# Altium project BYD_Leg_OneLeg.PrjPcb
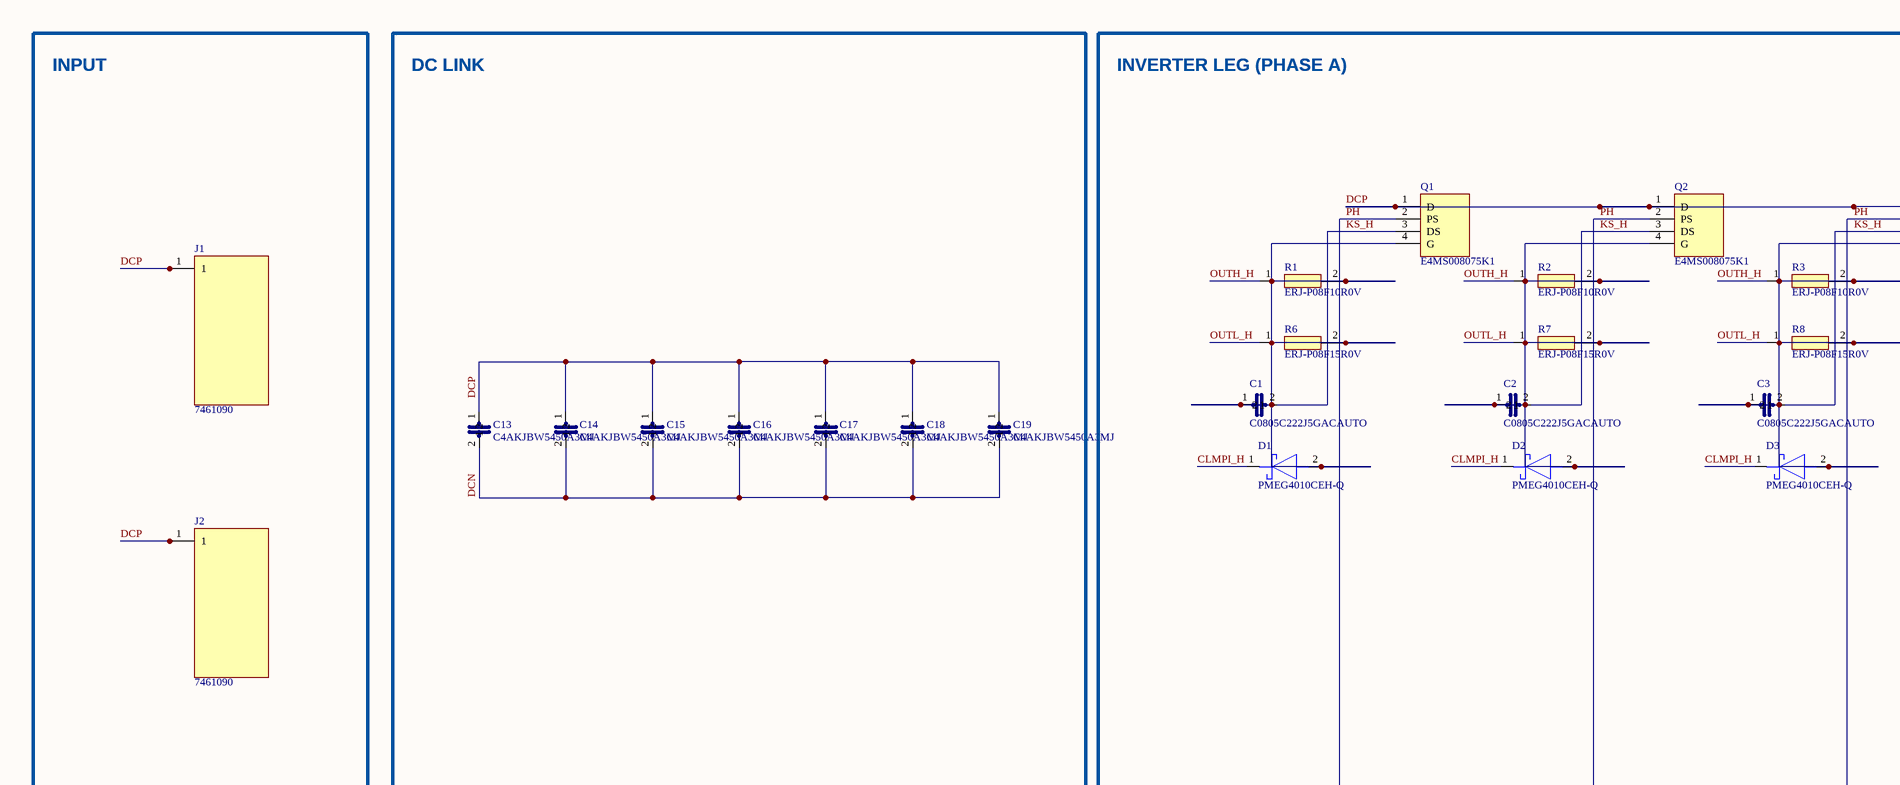
[diagram p0: BYD_Leg_OneLeg.SchDoc, top left]
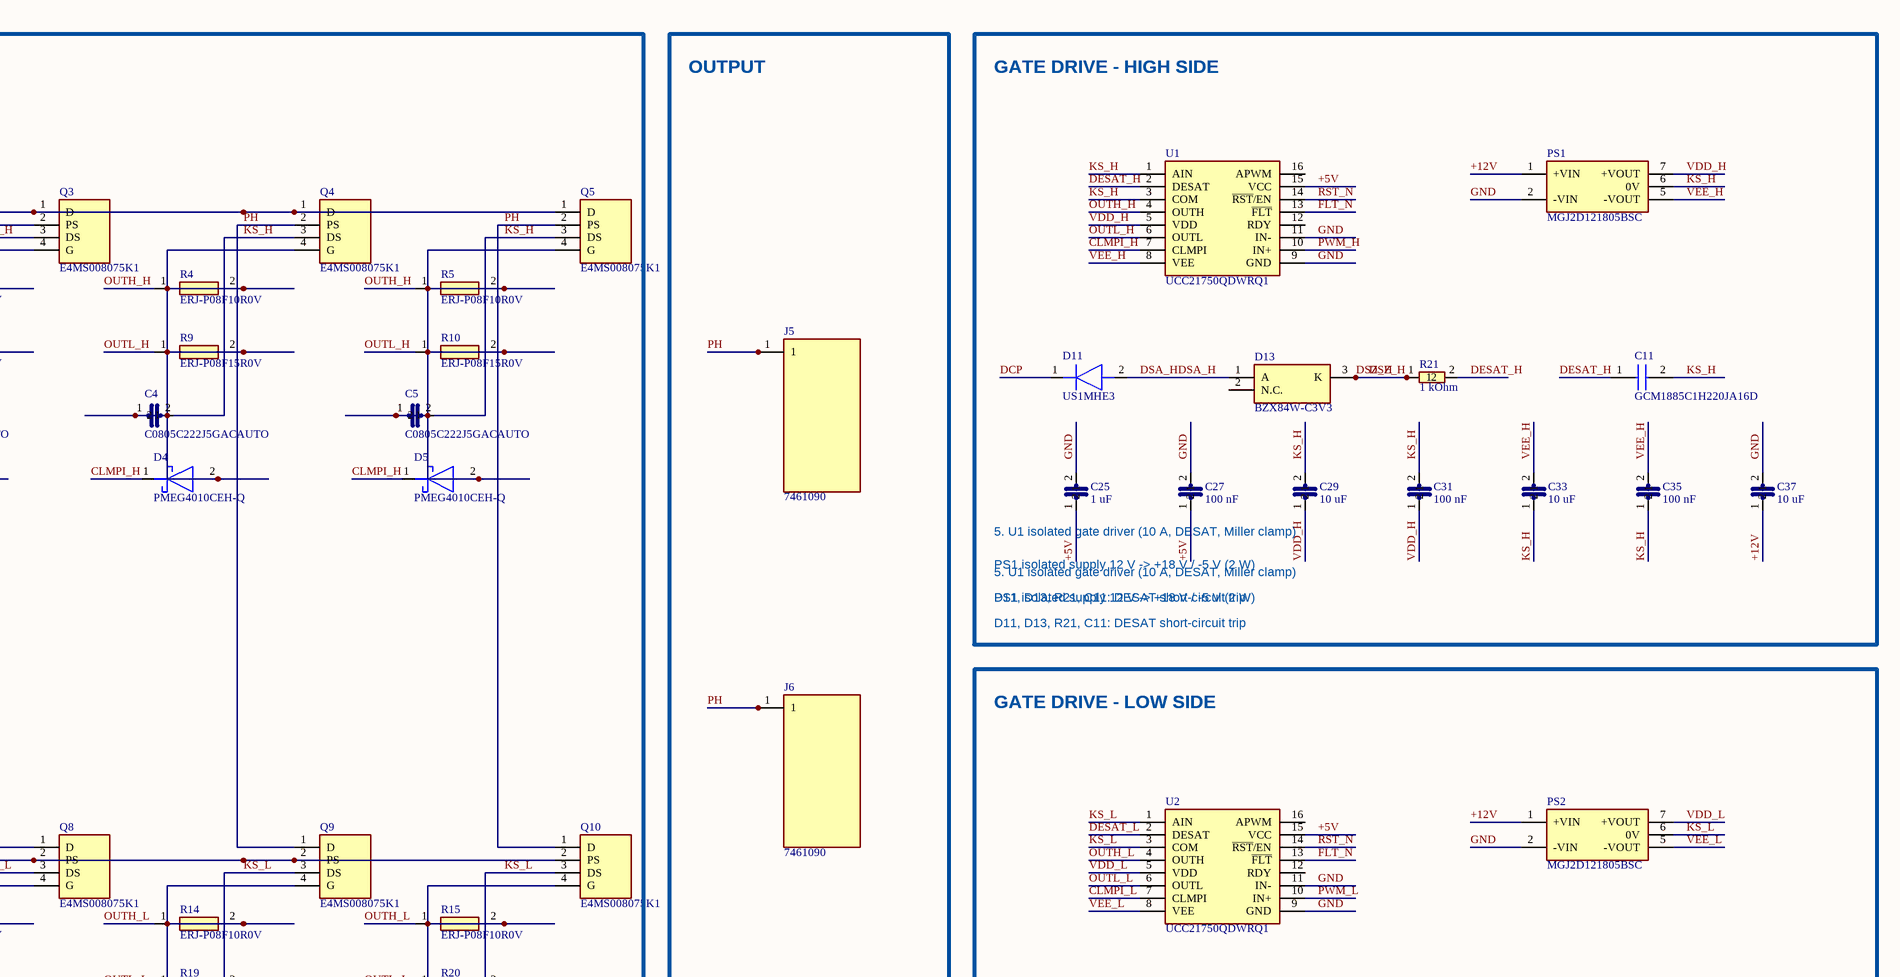
[diagram p1: BYD_Leg_OneLeg.SchDoc, top right]
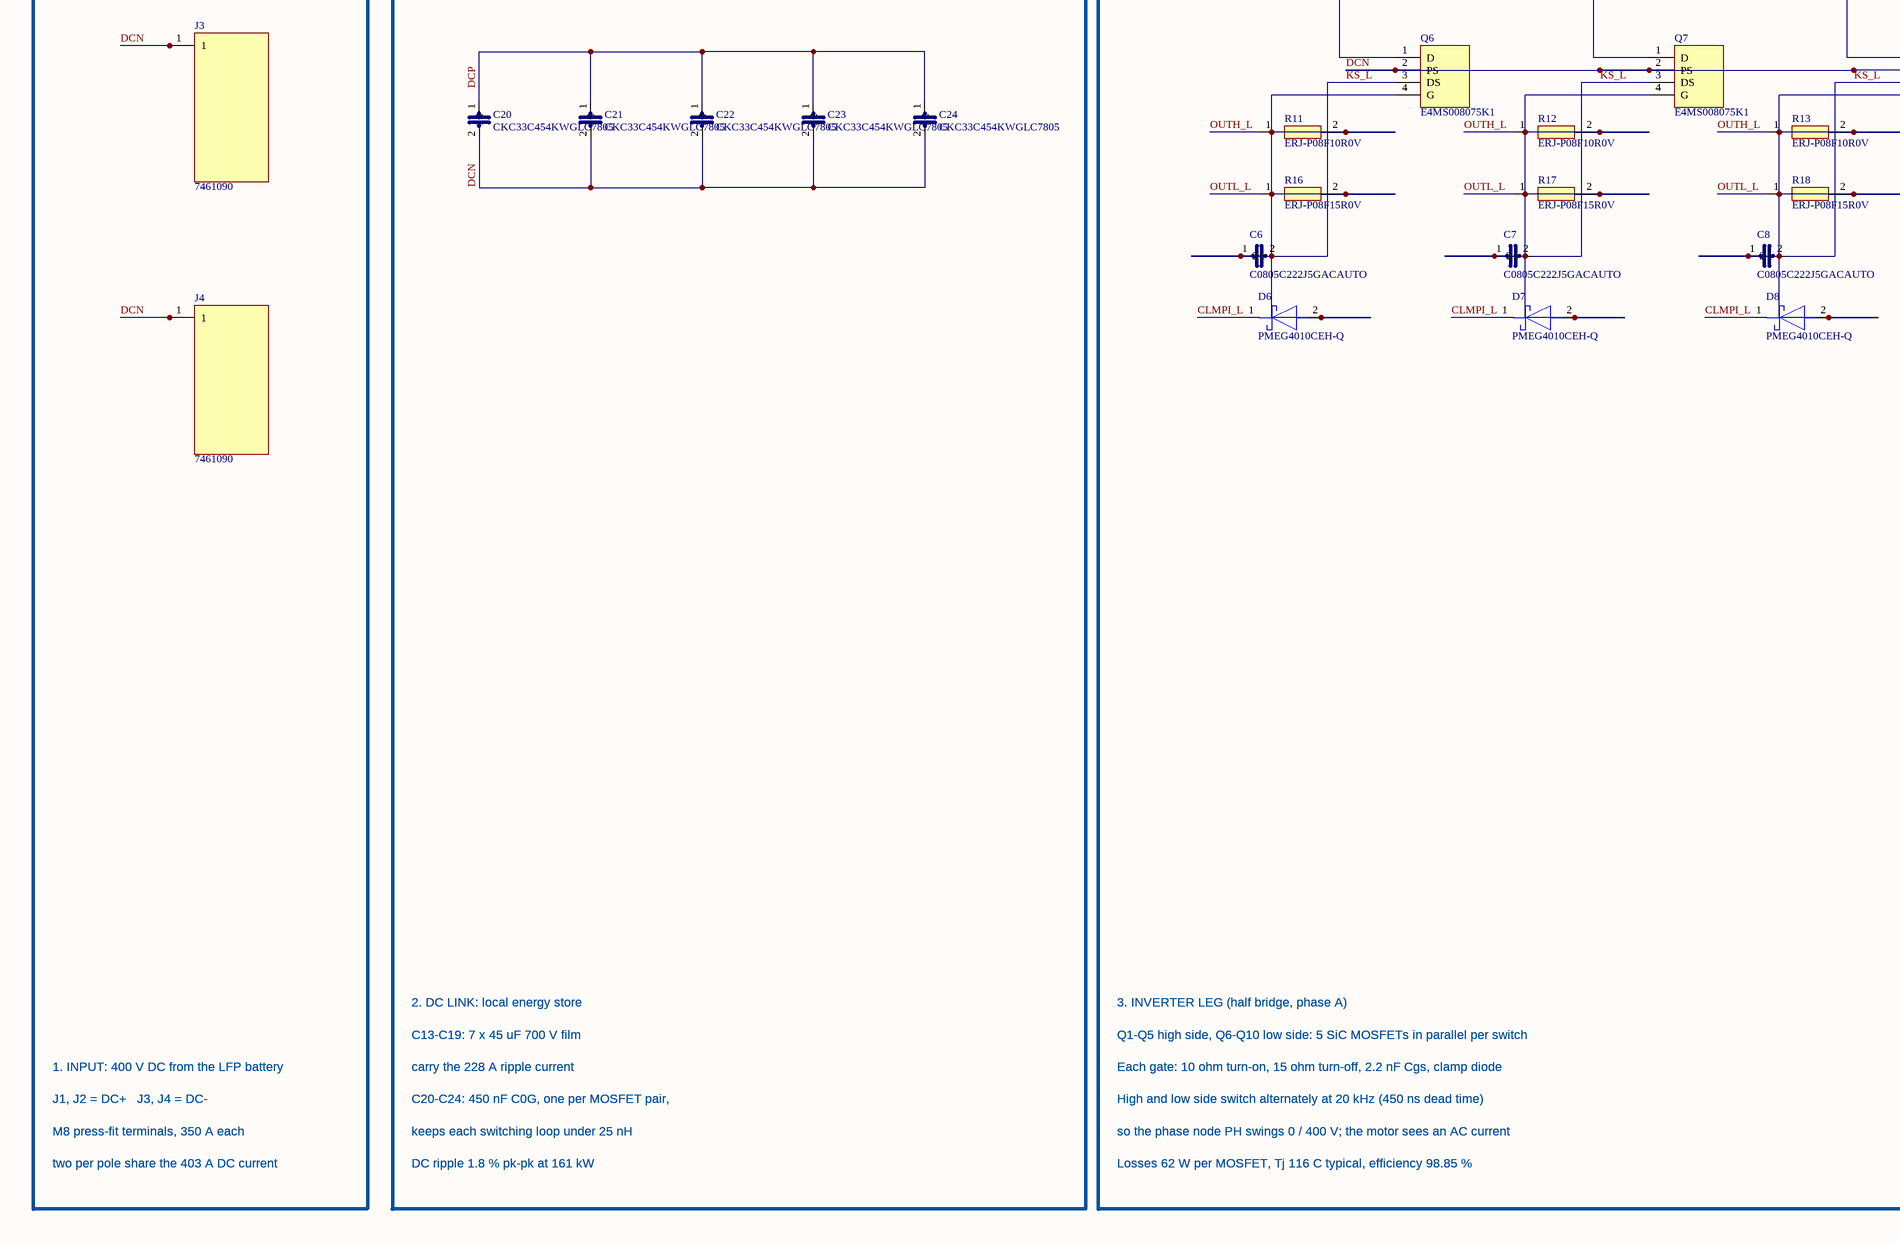
[diagram p2: BYD_Leg_OneLeg.SchDoc, bottom left]
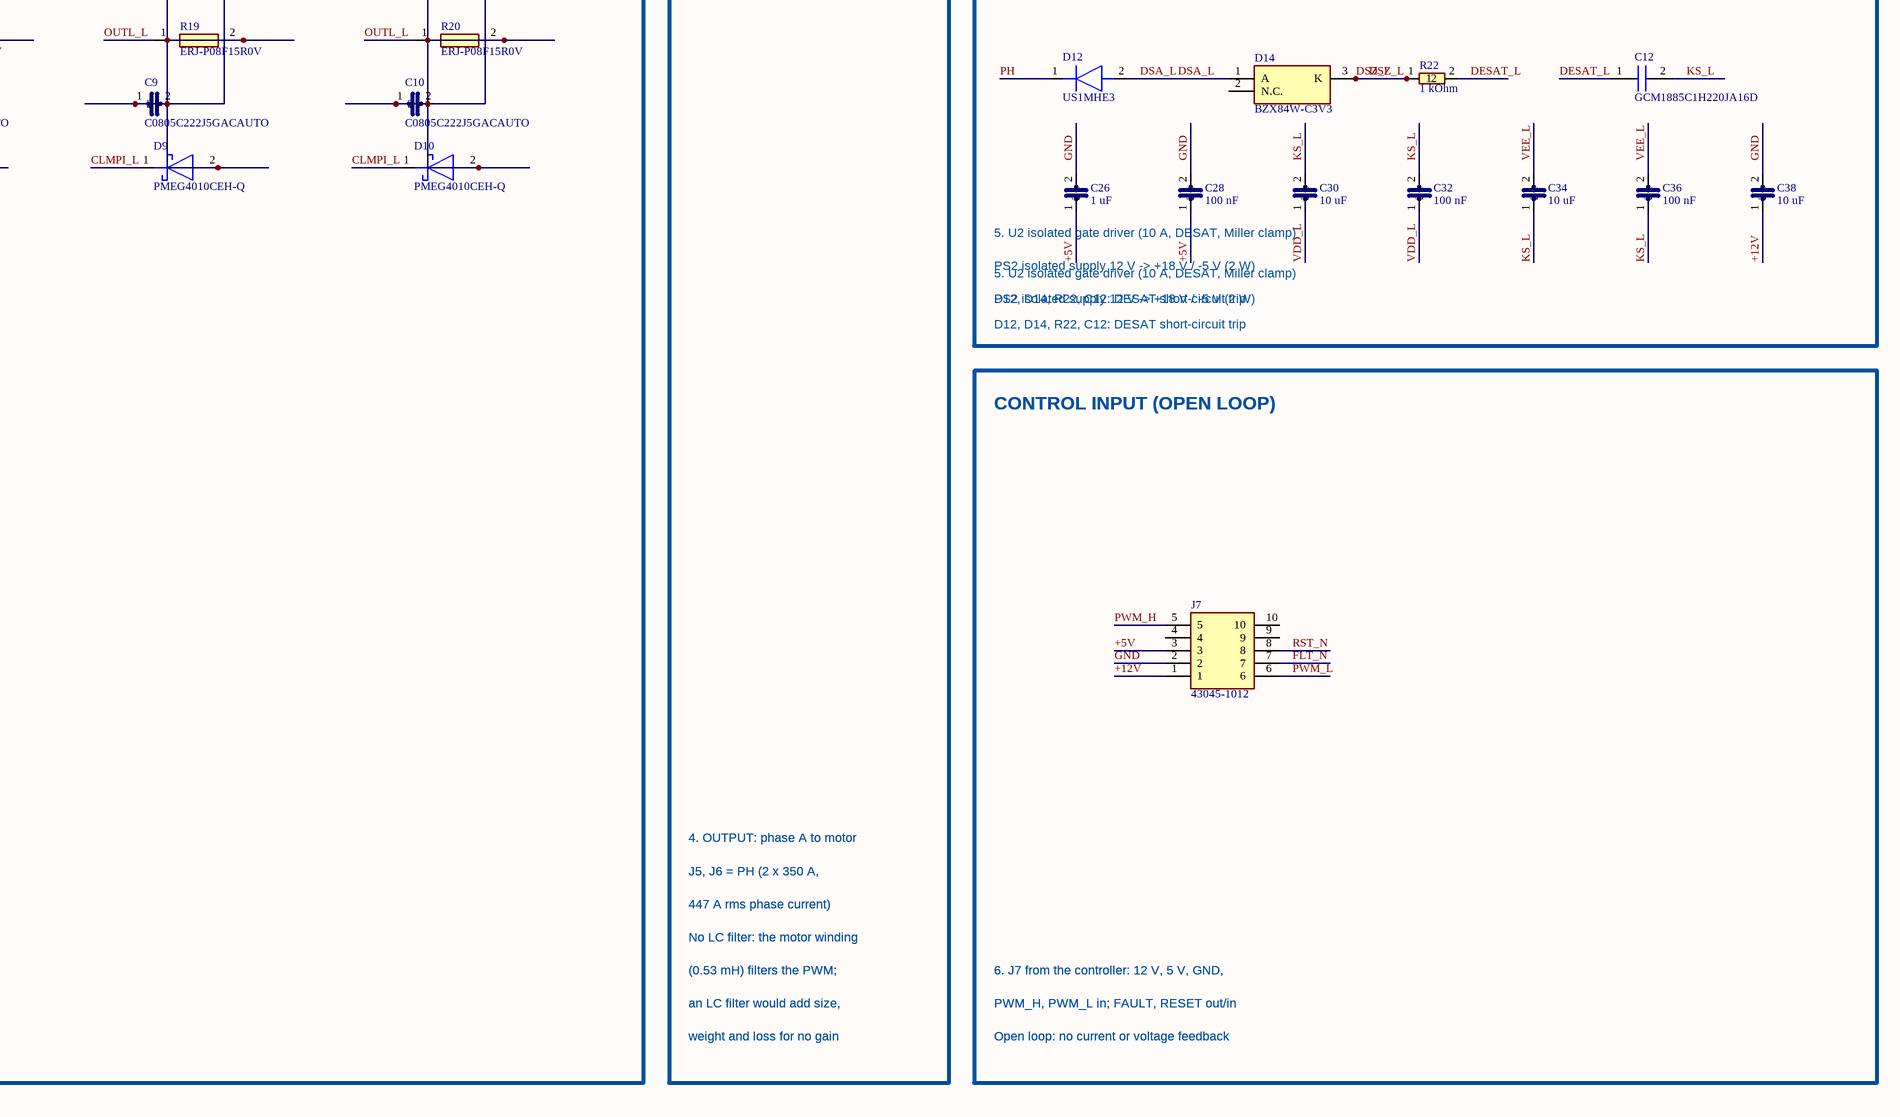
[diagram p3: BYD_Leg_OneLeg.SchDoc, bottom right]
1 sheet, 95 parts. Net scope: global (net labels, ports and power ports of the same name join across sheets).
Board file: BYD_Leg_OneLeg.PcbDoc

## Sheet BYD_Leg_OneLeg.SchDoc
size 762 x 469 mm

### Parts
C1  C0805C222J5GACAUTO  [CAPC2012_0805]
C2  C0805C222J5GACAUTO  [CAPC2012_0805]
C3  C0805C222J5GACAUTO  [CAPC2012_0805]
C4  C0805C222J5GACAUTO  [CAPC2012_0805]
C5  C0805C222J5GACAUTO  [CAPC2012_0805]
C6  C0805C222J5GACAUTO  [CAPC2012_0805]
C7  C0805C222J5GACAUTO  [CAPC2012_0805]
C8  C0805C222J5GACAUTO  [CAPC2012_0805]
C9  C0805C222J5GACAUTO  [CAPC2012_0805]
C10  C0805C222J5GACAUTO  [CAPC2012_0805]
C11  GCM1885C1H220JA16D  [CAPC1608X90N]
C12  GCM1885C1H220JA16D  [CAPC1608X90N]
C13  C4AKJBW5450A3MJ  [C4AK_52P5]
C14  C4AKJBW5450A3MJ  [C4AK_52P5]
C15  C4AKJBW5450A3MJ  [C4AK_52P5]
C16  C4AKJBW5450A3MJ  [C4AK_52P5]
C17  C4AKJBW5450A3MJ  [C4AK_52P5]
C18  C4AKJBW5450A3MJ  [C4AK_52P5]
C19  C4AKJBW5450A3MJ  [C4AK_52P5]
C20  CKC33C454KWGLC7805  [KCLINK_3640]
C21  CKC33C454KWGLC7805  [KCLINK_3640]
C22  CKC33C454KWGLC7805  [KCLINK_3640]
C23  CKC33C454KWGLC7805  [KCLINK_3640]
C24  CKC33C454KWGLC7805  [KCLINK_3640]
C25  1 uF  [CAPC1608X90N]
C26  1 uF  [CAPC1608X90N]
C27  100 nF  [CAPC1608X90N]
C28  100 nF  [CAPC1608X90N]
C29  10 uF  [CAPC3225_1210]
C30  10 uF  [CAPC3225_1210]
C31  100 nF  [CAPC1608X90N]
C32  100 nF  [CAPC1608X90N]
C33  10 uF  [CAPC3225_1210]
C34  10 uF  [CAPC3225_1210]
C35  100 nF  [CAPC1608X90N]
C36  100 nF  [CAPC1608X90N]
C37  10 uF  [CAPC3225_1210]
C38  10 uF  [CAPC3225_1210]
D1  PMEG4010CEH-Q  [SOD3516X120N]
D2  PMEG4010CEH-Q  [SOD3516X120N]
D3  PMEG4010CEH-Q  [SOD3516X120N]
D4  PMEG4010CEH-Q  [SOD3516X120N]
D5  PMEG4010CEH-Q  [SOD3516X120N]
D6  PMEG4010CEH-Q  [SOD3516X120N]
D7  PMEG4010CEH-Q  [SOD3516X120N]
D8  PMEG4010CEH-Q  [SOD3516X120N]
D9  PMEG4010CEH-Q  [SOD3516X120N]
D10  PMEG4010CEH-Q  [SOD3516X120N]
D11  US1MHE3  [DIOM5127X229N]
D12  US1MHE3  [DIOM5127X229N]
D13  BZX84W-C3V3  [SOT65P210X110-3N]
D14  BZX84W-C3V3  [SOT65P210X110-3N]
J1  7461090  [7461090]
J2  7461090  [7461090]
J3  7461090  [7461090]
J4  7461090  [7461090]
J5  7461090  [7461090]
J6  7461090  [7461090]
J7  43045-1012  [43045-10YY_121314]
PS1  MGJ2D121805BSC  [SIP7_MGJ2]
PS2  MGJ2D121805BSC  [SIP7_MGJ2]
Q1  E4MS008075K1  [E4M0060075K1]
Q2  E4MS008075K1  [E4M0060075K1]
Q3  E4MS008075K1  [E4M0060075K1]
Q4  E4MS008075K1  [E4M0060075K1]
Q5  E4MS008075K1  [E4M0060075K1]
Q6  E4MS008075K1  [E4M0060075K1]
Q7  E4MS008075K1  [E4M0060075K1]
Q8  E4MS008075K1  [E4M0060075K1]
Q9  E4MS008075K1  [E4M0060075K1]
Q10  E4MS008075K1  [E4M0060075K1]
R1  ERJ-P08F10R0V  [ERJP08_(1206)]
R2  ERJ-P08F10R0V  [ERJP08_(1206)]
R3  ERJ-P08F10R0V  [ERJP08_(1206)]
R4  ERJ-P08F10R0V  [ERJP08_(1206)]
R5  ERJ-P08F10R0V  [ERJP08_(1206)]
R6  ERJ-P08F15R0V  [ERJP08_(1206)]
R7  ERJ-P08F15R0V  [ERJP08_(1206)]
R8  ERJ-P08F15R0V  [ERJP08_(1206)]
R9  ERJ-P08F15R0V  [ERJP08_(1206)]
R10  ERJ-P08F15R0V  [ERJP08_(1206)]
R11  ERJ-P08F10R0V  [ERJP08_(1206)]
R12  ERJ-P08F10R0V  [ERJP08_(1206)]
R13  ERJ-P08F10R0V  [ERJP08_(1206)]
R14  ERJ-P08F10R0V  [ERJP08_(1206)]
R15  ERJ-P08F10R0V  [ERJP08_(1206)]
R16  ERJ-P08F15R0V  [ERJP08_(1206)]
R17  ERJ-P08F15R0V  [ERJP08_(1206)]
R18  ERJ-P08F15R0V  [ERJP08_(1206)]
R19  ERJ-P08F15R0V  [ERJP08_(1206)]
R20  ERJ-P08F15R0V  [ERJP08_(1206)]
R21  1 kOhm  [RESC2012_0805]
R22  1 kOhm  [RESC2012_0805]
U1  UCC21750QDWRQ1  [SOIC127P1030X265-16N]
U2  UCC21750QDWRQ1  [SOIC127P1030X265-16N]

### Nets
+5V: C25.1 C26.1 C27.1 C28.1 J7.3 U1.15(VCC) U2.15(VCC)
+12V: C37.1 C38.1 J7.1 PS1.1(+VIN) PS2.1(+VIN)
CLMPI_H: D1.1(K) D2.1(K) D3.1(K) D4.1(K) D5.1(K) U1.7(CLMPI)
CLMPI_L: D6.1(K) D7.1(K) D8.1(K) D9.1(K) D10.1(K) U2.7(CLMPI)
DCN: C13.2 C14.2 C15.2 C16.2 C17.2 C18.2 C19.2 C20.2 C21.2 C22.2 C23.2 C24.2 J3.1 J3.2 J3.3 J3.4 J3.5 J3.6 J3.7 J3.8 J3.9 J3.10 J3.11 J3.12 J3.13 J3.14 J3.15 J3.16 J3.17 J3.18 J3.19 J3.20 J3.22(MH1) J4.1 J4.2 J4.3 J4.4 J4.5 J4.6 J4.7 J4.8 J4.9 J4.10 J4.11 J4.12 J4.13 J4.14 J4.15 J4.16 J4.17 J4.18 J4.19 J4.20 J4.22(MH1) Q6.2(PS) Q7.2(PS) Q8.2(PS) Q9.2(PS) Q10.2(PS)
DCP: C13.1 C14.1 C15.1 C16.1 C17.1 C18.1 C19.1 C20.1 C21.1 C22.1 C23.1 C24.1 D11.1(K) J1.1 J1.2 J1.3 J1.4 J1.5 J1.6 J1.7 J1.8 J1.9 J1.10 J1.11 J1.12 J1.13 J1.14 J1.15 J1.16 J1.17 J1.18 J1.19 J1.20 J1.22(MH1) J2.1 J2.2 J2.3 J2.4 J2.5 J2.6 J2.7 J2.8 J2.9 J2.10 J2.11 J2.12 J2.13 J2.14 J2.15 J2.16 J2.17 J2.18 J2.19 J2.20 J2.22(MH1) Q1.1(D) Q2.1(D) Q3.1(D) Q4.1(D) Q5.1(D)
DESAT_H: C11.1 R21.2 U1.2(DESAT)
DESAT_L: C12.1 R22.2 U2.2(DESAT)
DSA_H: D11.2(A) D13.1(A)
DSA_L: D12.2(A) D14.1(A)
DSZ_H: D13.3(K) R21.1
DSZ_L: D14.3(K) R22.1
FLT_N: J7.7 U1.13(~{FLT}) U2.13(~{FLT})
GND: C25.2 C26.2 C27.2 C28.2 C37.2 C38.2 J7.2 PS1.2(-VIN) PS2.2(-VIN) U1.9(GND) U1.11(IN-) U2.9(GND) U2.11(IN-)
KS_H: C1.2 C2.2 C3.2 C4.2 C5.2 C11.2 C29.2 C31.2 C33.1 C35.1 PS1.6(0V) Q1.3(DS) Q2.3(DS) Q3.3(DS) Q4.3(DS) Q5.3(DS) U1.1(AIN) U1.3(COM)
KS_L: C6.2 C7.2 C8.2 C9.2 C10.2 C12.2 C30.2 C32.2 C34.1 C36.1 PS2.6(0V) Q6.3(DS) Q7.3(DS) Q8.3(DS) Q9.3(DS) Q10.3(DS) U2.1(AIN) U2.3(COM)
OUTH_H: R1.1 R2.1 R3.1 R4.1 R5.1 U1.4(OUTH)
OUTH_L: R11.1 R12.1 R13.1 R14.1 R15.1 U2.4(OUTH)
OUTL_H: R6.1 R7.1 R8.1 R9.1 R10.1 U1.6(OUTL)
OUTL_L: R16.1 R17.1 R18.1 R19.1 R20.1 U2.6(OUTL)
PH: D12.1(K) J5.1 J5.2 J5.3 J5.4 J5.5 J5.6 J5.7 J5.8 J5.9 J5.10 J5.11 J5.12 J5.13 J5.14 J5.15 J5.16 J5.17 J5.18 J5.19 J5.20 J5.22(MH1) J6.1 J6.2 J6.3 J6.4 J6.5 J6.6 J6.7 J6.8 J6.9 J6.10 J6.11 J6.12 J6.13 J6.14 J6.15 J6.16 J6.17 J6.18 J6.19 J6.20 J6.22(MH1) Q1.2(PS) Q2.2(PS) Q3.2(PS) Q4.2(PS) Q5.2(PS) Q6.1(D) Q7.1(D) Q8.1(D) Q9.1(D) Q10.1(D)
PWM_H: J7.5 U1.10(IN+)
PWM_L: J7.6 U2.10(IN+)
RST_N: J7.8 U1.14(~{RST}/EN) U2.14(~{RST}/EN)
VDD_H: C29.1 C31.1 PS1.7(+VOUT) U1.5(VDD)
VDD_L: C30.1 C32.1 PS2.7(+VOUT) U2.5(VDD)
VEE_H: C33.2 C35.2 PS1.5(-VOUT) U1.8(VEE)
VEE_L: C34.2 C36.2 PS2.5(-VOUT) U2.8(VEE)
NetC1_1: C1.1 D1.2(A) Q1.4(G) R1.2 R6.2
NetC2_1: C2.1 D2.2(A) Q2.4(G) R2.2 R7.2
NetC3_1: C3.1 D3.2(A) Q3.4(G) R3.2 R8.2
NetC4_1: C4.1 D4.2(A) Q4.4(G) R4.2 R9.2
NetC5_1: C5.1 D5.2(A) Q5.4(G) R5.2 R10.2
NetC6_1: C6.1 D6.2(A) Q6.4(G) R11.2 R16.2
NetC7_1: C7.1 D7.2(A) Q7.4(G) R12.2 R17.2
NetC8_1: C8.1 D8.2(A) Q8.4(G) R13.2 R18.2
NetC9_1: C9.1 D9.2(A) Q9.4(G) R14.2 R19.2
NetC10_1: C10.1 D10.2(A) Q10.4(G) R15.2 R20.2

Not connected (* = marked no-connect by the designer): D13 2(N.C.); D14 2(N.C.); J7 4 9 10; U1 12(RDY) 16(APWM); U2 12(RDY) 16(APWM)

### Notes on the sheet
- INPUT
- DC LINK
- INVERTER LEG (PHASE A)
- OUTPUT
- GATE DRIVE - HIGH SIDE
- 5. U1 isolated gate driver (10 A, DESAT, Miller clamp)
- PS1 isolated supply 12 V -> +18 V / -5 V (2 W)
- D11, D13, R21, C11: DESAT short-circuit trip
- GATE DRIVE - LOW SIDE
- 5. U2 isolated gate driver (10 A, DESAT, Miller clamp)
- PS2 isolated supply 12 V -> +18 V / -5 V (2 W)
- D12, D14, R22, C12: DESAT short-circuit trip
- CONTROL INPUT (OPEN LOOP)
- 4. OUTPUT: phase A to motor
- 2. DC LINK: local energy store
- C13-C19: 7 x 45 uF 700 V film
- 3. INVERTER LEG (half bridge, phase A)
- Q1-Q5 high side, Q6-Q10 low side: 5 SiC MOSFETs in parallel per switch
- J5, J6 = PH (2 x 350 A,
- 447 A rms phase current)
- 1. INPUT: 400 V DC from the LFP battery
- J1, J2 = DC+   J3, J4 = DC-
- carry the 228 A ripple current
- C20-C24: 450 nF C0G, one per MOSFET pair,
- Each gate: 10 ohm turn-on, 15 ohm turn-off, 2.2 nF Cgs, clamp diode
- High and low side switch alternately at 20 kHz (450 ns dead time)
- No LC filter: the motor winding
- (0.53 mH) filters the PWM;
- 6. J7 from the controller: 12 V, 5 V, GND,
- M8 press-fit terminals, 350 A each
- two per pole share the 403 A DC current
- keeps each switching loop under 25 nH
- DC ripple 1.8 % pk-pk at 161 kW
- so the phase node PH swings 0 / 400 V; the motor sees an AC current
- Losses 62 W per MOSFET, Tj 116 C typical, efficiency 98.85 %
- an LC filter would add size,
- weight and loss for no gain
- PWM_H, PWM_L in; FAULT, RESET out/in
- Open loop: no current or voltage feedback

### Library data of the parts
C1-C10 = CAP_NP: 2.2 nF 50 V C0G 0805 (external Cgs)
C11 C12 = GCM1885C1H220JA16D: 22 pF 50 V C0G 0603 DESAT blanking; Manufacturer_Name: Murata Electronics; Datasheet Link: https://search.murata.co.jp/Ceramy/image/img/A01X/G101/ENG/GCM1885C1H220JA16-01A.pdf; Height: 0.9mm; Manufacturer_Part_Number: GCM1885C1H220JA16D; Mouser Part Number: 81-GCM1885C1H220J16D; Mouser Price/Stock: https://www.mouser.com/Search/Refine.aspx?Keyword=81-GCM1885C1H220J16D; Arrow Part Number: GCM1885C1H220JA16D; Arrow Price/Stock: https://www.arrow.com/en/products/gcm1885c1h220ja16d/murata-manufacturing?utm_currency=USD&region=europe
C13-C19 = CAP_NP: 45 uF 700 V DC-link film (KEMET C4AK)
C20-C24 = CAP_NP: 450 nF 650 V C0G KC-LINK, one per device pair
C25 C26 = CAP_NP: 1 uF 16 V X7R 0603, driver VCC
C27 C28 = CAP_NP: 100 nF 50 V X7R 0603, driver VCC
C29 C30 = CAP_NP: 10 uF 50 V X7R 1210, driver VDD-COM
C31 C32 = CAP_NP: 100 nF 50 V X7R 0603, driver VDD-COM
C33 C34 = CAP_NP: 10 uF 50 V X7R 1210, driver COM-VEE
C35 C36 = CAP_NP: 100 nF 50 V X7R 0603, driver COM-VEE
C37 C38 = CAP_NP: 10 uF 50 V X7R 1210, bias VIN
D1-D10 = PMEG4010CEH: 40 V 1 A Schottky gate clamp; Manufacturer_Name: Nexperia; Datasheet Link: https://datasheet.datasheetarchive.com/originals/distributors/SFDatasheet-4/sf-00082344.pdf; Height: 1.2mm; Manufacturer_Part_Number: PMEG4010CEH; Mouser Part Number: N/A; Mouser Price/Stock: https://www.mouser.co.uk/ProductDetail/Nexperia/PMEG4010CEH?qs=vHuUswq2%252BszYBzs3vH3ikw%3D%3D
D11 D12 = US1MHE3_61T: 1000 V 1 A ultrafast DESAT diode; Manufacturer_Name: Vishay; Manufacturer_Part_Number: US1MHE3/61T; Datasheet Link: https://www.vishay.com/docs/88768/us1_test_dcicons.pdf; Height: 2.29mm; Mouser Part Number: 625-US1MHE3; Mouser Price/Stock: https://www.mouser.co.uk/ProductDetail/Vishay-Semiconductors/US1MHE3-61T?qs=D6r9GjgEnNNyhtP47Emw%252Bg%3D%3D
D13 D14 = BZX84W-C3V3F: 3.3 V Zener, DESAT threshold offset; Manufacturer_Name: Nexperia; Datasheet Link: https://assets.nexperia.com/documents/data-sheet/BZX84W_SER.pdf; Height: 1.1mm; Manufacturer_Part_Number: BZX84W-C3V3F; Mouser Part Number: 771-BZX84W-C3V3F; Mouser Price/Stock: https://www.mouser.co.uk/ProductDetail/Nexperia/BZX84W-C3V3F?qs=MLItCLRbWsyTlmZP9y0kXg%3D%3D; Arrow Part Number: BZX84W-C3V3F; Arrow Price/Stock: https://www.arrow.com/en/products/bzx84w-c3v3f/nexperia.html?utm_currency=USD&region=europe
J1-J6 = 7461090: REDCUBE M8 press-fit power terminal 350 A; Manufacturer_Name: Wurth Elektronik; Datasheet Link: https://www.we-online.com/catalog/datasheet/7461090.pdf; Height: 13.5mm; Manufacturer_Part_Number: 7461090; Mouser Part Number: 710-7461090; Mouser Price/Stock: https://www.mouser.co.uk/ProductDetail/Wurth-Elektronik/7461090?qs=lykWx4dhCCGdDXRKZo1kEg%3D%3D
J7 = 43045-1012: Control connector 2x5 Micro-Fit 3.0; Manufacturer_Name: Molex; Datasheet Link: https://www.molex.com/pdm_docs/sd/430450612_sd.pdf; Height: 9.91mm; Manufacturer_Part_Number: 43045-1012; Mouser Part Number: 538-43045-1012; Mouser Price/Stock: https://www.mouser.co.uk/ProductDetail/Molex/43045-1012?qs=KC2ywxza1koTZPAgAiHw3w%3D%3D
PS1 PS2 = MGJ2D121805BSC: Isolated DC/DC 12 V to +18 V / -5 V, 2 W, 5.4 kV (Murata MGJ2B)
Q1-Q10 = E4M0015075K1: MOSFET (N-Channel); Manufacturer_Name: Wolfspeed; Datasheet Link: https://assets.wolfspeed.com/uploads/2024/04/Wolfspeed_E4M0015075K1_data_sheet.pdf; Height: 21.14mm; Manufacturer_Part_Number: E4M0015075K1; Mouser Part Number: 941-E4M0015075K1; Mouser Price/Stock: https://www.mouser.co.uk/ProductDetail/Wolfspeed/E4M0015075K1?qs=dbcCsuKDzFXJMp4AtpeCVw%3D%3D; Arrow Part Number: E4M0015075K1; Arrow Price/Stock: https://www.arrow.com/en/products/e4m0015075k1/wolfspeed.html?utm_currency=USD&region=nac
R1-R5 R11-R15 = ERJ-P08F10R0V: 10 Ohm 1% 1206 0.66 W anti-surge (RG,on); Manufacturer_Name: Panasonic; Datasheet Link: http://industrial.panasonic.com/cdbs/www-data/pdf/RDO0000/AOA0000C331.pdf; Height: 0.7mm; Manufacturer_Part_Number: ERJ-P08F10R0V; Mouser Part Number: 667-ERJ-P08F10R0V; Mouser Price/Stock: https://www.mouser.co.uk/ProductDetail/Panasonic/ERJ-P08F10R0V?qs=iIVTEDlrHA2fc4Vdv4Btrw%3D%3D; Arrow Part Number: ERJ-P08F10R0V; Arrow Price/Stock: https://www.arrow.com/en/products/erj-p08f10r0v/panasonic?region=nac
R6-R10 R16-R20 = ERJ-P08F15R0V: 15 Ohm 1% 1206 0.66 W anti-surge (RG,off); Manufacturer_Name: Panasonic; Datasheet Link: http://industrial.panasonic.com/cdbs/www-data/pdf/RDO0000/AOA0000C331.pdf; Height: 0.7mm; Manufacturer_Part_Number: ERJ-P08F15R0V; Mouser Part Number: 667-ERJ-P08F15R0V; Mouser Price/Stock: https://www.mouser.co.uk/ProductDetail/Panasonic/ERJ-P08F15R0V?qs=iIVTEDlrHA16GO8SZGWd2Q%3D%3D; Arrow Part Number: ERJ-P08F15R0V; Arrow Price/Stock: https://www.arrow.com/en/products/erjp08f15r0v/panasonic?utm_currency=USD&region=nac
R21 R22 = RES: 1 kOhm 1% 0805 DESAT series resistor
U1 U2 = UCC21750QDWRQ1: Isolated SiC gate driver, 10 A, DESAT, Miller clamp; Manufacturer_Name: Texas Instruments; Datasheet Link: https://www.ti.com/lit/gpn/UCC21750-Q1; Height: 2.65mm; Manufacturer_Part_Number: UCC21750QDWRQ1; Mouser Part Number: 595-UCC21750QDWRQ1; Mouser Price/Stock: https://www.mouser.co.uk/ProductDetail/Texas-Instruments/UCC21750QDWRQ1?qs=BJlw7L4Cy7%2FADnnEzoLd5w%3D%3D; Arrow Part Number: UCC21750QDWRQ1; Arrow Price/Stock: https://www.arrow.com/en/products/ucc21750qdwrq1/texas-instruments.html?utm_currency=USD&region=nac